# Altium schematic sheet RF_FILTER_Sheet1.SchDoc
size A; SheetNumber: 1; SheetTotal: 1
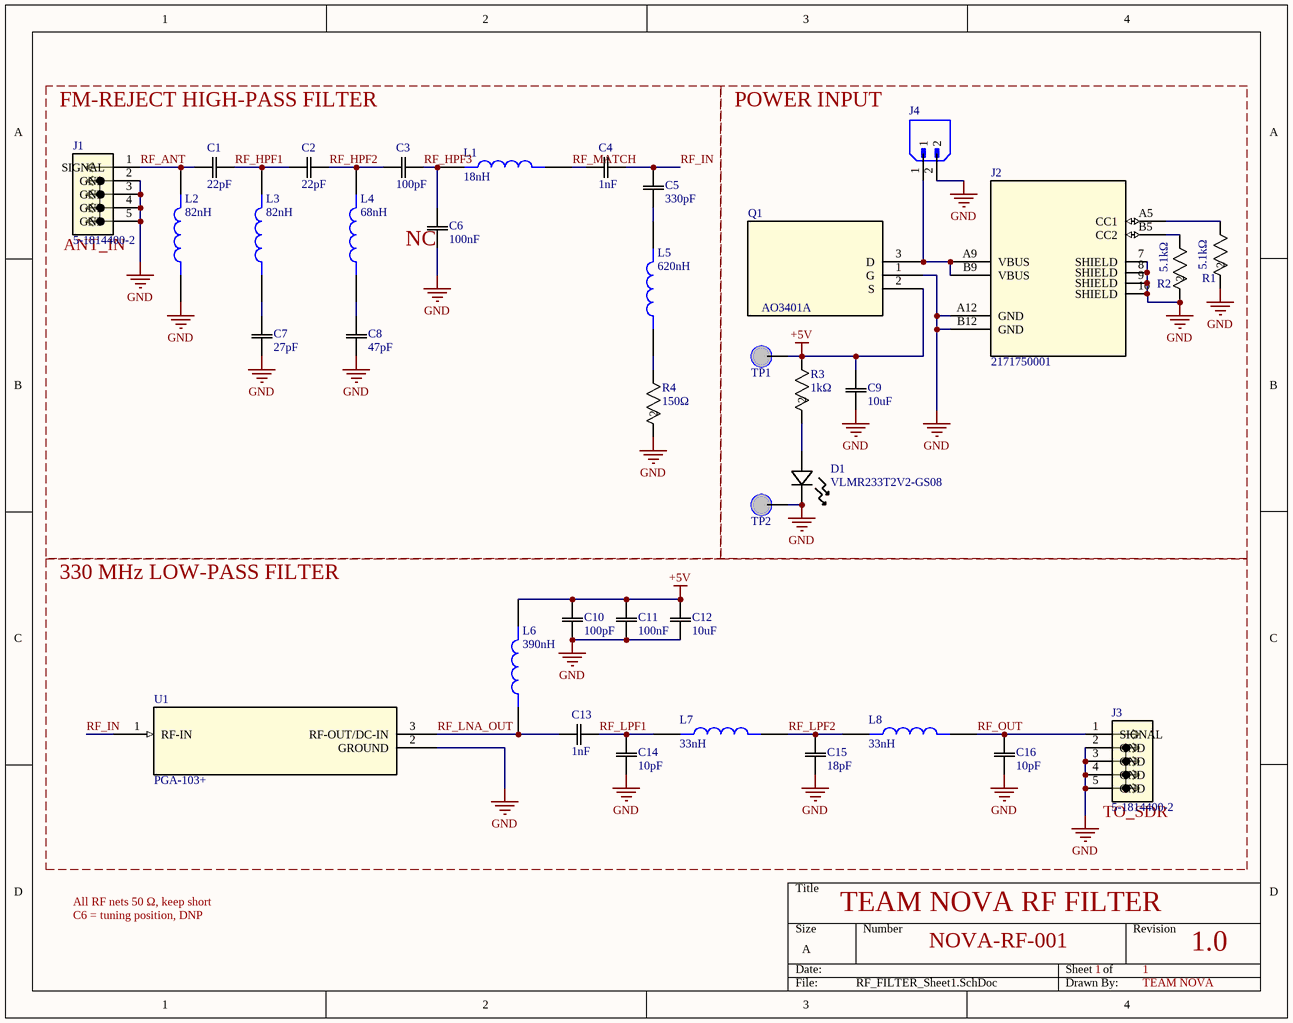
[diagram p0: RF_FILTER_Sheet1.SchDoc]

## Parts
C1  22pF  [CAPC220145_88N_KEM]
C2  22pF  [CAPC220145_88N_KEM]
C3  100pF  [CAPC220145_88N_KEM]
C4  1nF  [CAPC220145_88N_KEM]
C5  330pF  [CAPC220145_88N_KEM]
C6  100nF  [CAPC220145_88N_KEM]
C7  27pF  [CAPC220145_88N_KEM]
C8  47pF  [CAPC220145_88N_KEM]
C9  10uF  [CAPC220145_88N_KEM]
C10  100pF  [CAPC220145_88N_KEM]
C11  100nF  [CAPC220145_88N_KEM]
C12  10uF  [CAPC220145_88N_KEM]
C13  1nF  [CAPC220145_88N_KEM]
C14  10pF  [CAPC220145_88N_KEM]
C15  18pF  [CAPC220145_88N_KEM]
C16  10pF  [CAPC220145_88N_KEM]
D1  VLMR233T2V2-GS08  [LED_VISHAY_VLMX233_VIS]
J1  5-1814400-2  [COAX4GND_5-1814400-2_TEC]
J2  2171750001  [2171750001_MOL]
J3  5-1814400-2  [COAX4GND_5-1814400-2_TEC]
J4  B2B-XH-A(LF)(SN)  [JST_B2B-XH-A]  (value not drawn)
L1  18nH  [IND_AISC-0805-R082J-T]
L2  82nH  [IND_AISC-0805-R082J-T]
L3  82nH  [IND_AISC-0805-R082J-T]
L4  68nH  [IND_AISC-0805-R082J-T]
L5  620nH  [IND_AISC-0805-R082J-T]
L6  390nH  [IND_AISC-0805-R082J-T]
L7  33nH  [IND_AISC-0805-R082J-T]
L8  33nH  [IND_AISC-0805-R082J-T]
Q1  AO3401A  [SOT-23-3L_AOS]
R1  5.1kΩ  [RC0805N_YAG]
R2  5.1kΩ  [RC0805N_YAG]
R3  1kΩ  [RC0805N_YAG]
R4  150Ω  [RC0805N_YAG]
TP1  TestPoint  [TP_PTH_1.0]  (value not drawn)  (no BOM)
TP2  TestPoint  [TP_PTH_1.0]  (value not drawn)  (no BOM)
U1  PGA-103+  [DF782_MNC-M]

## Blocks framed on the sheet
POWER INPUT: C9 D1 J2 J4 Q1 R1-R3 TP1 TP2
330 MHz LOW-PASS FILTER: C10-C16 J3 L6-L8 U1

## Nets
+5V: C9.2 C10.2 C11.2 C12.2 L6.2 Q1.2(S) R3.1 TP1.1
GND: C6.1 C7.1 C8.1 C9.1 C10.1 C11.1 C12.1 C14.1 C15.1 C16.1 D1.1 J1.2(GND) J1.3(GND) J1.4(GND) J1.5(GND) J2.7(SHIELD) J2.8(SHIELD) J2.9(SHIELD) J2.10(SHIELD) J2.A12(GND) J2.B12(GND) J3.2(GND) J3.3(GND) J3.4(GND) J3.5(GND) J4.2 L2.1 Q1.1(G) R1.2 R2.2 R4.2 TP2.1 U1.2(GROUND)
RF_ANT: C1.1 J1.1(SIGNAL) L2.2
RF_HPF1: C1.2 C2.1 L3.2
RF_HPF2: C2.2 C3.1 L4.2
RF_HPF3: C3.2 C6.2 L1.1
RF_IN: C4.2 C5.2 U1.1(RF-IN)
RF_LNA_OUT: C13.1 L6.1 U1.3(RF-OUT/DC-IN)
RF_LPF1: C13.2 C14.2 L7.1
RF_LPF2: C15.2 L7.2 L8.1
RF_MATCH: C4.1 L1.2
RF_OUT: C16.2 J3.1(SIGNAL) L8.2
NetC5_1: C5.1 L5.2
NetC7_2: C7.2 L3.1
NetC8_2: C8.2 L4.1
NetD1_2: D1.2 R3.2
NetJ2_A5: J2.A5(CC1) R1.1
NetJ2_A9: J2.A9(VBUS) J2.B9(VBUS) J4.1 Q1.3(D)
NetJ2_B5: J2.B5(CC2) R2.1
NetL5_1: L5.1 R4.1

## Notes on the sheet
- FM-REJECT HIGH-PASS FILTER
- (near J1) ANT_IN
- (near C6) NC
- (near J3) TO_SDR
- All RF nets 50 Ω, keep short
- C6 = tuning position, DNP
- TEAM NOVA RF FILTER
- NOVA-RF-001
- 1
- 1.0
- TEAM NOVA

## Library data of the parts
C1 C2 = 0805CG220J500NT: CAP CER 22pF 50V C0G 0805; Manufacturer: FH (Guangdong Fenghua Advanced Tech); Manufacturer Part Number: 0805CG220J500NT; Value: 22pF; LCSC Part #: C24658
C3 C10 = 0805CG101J500NT: CAP CER 100pF 50V C0G 0805; Manufacturer: FH (Guangdong Fenghua Advanced Tech); Manufacturer Part Number: 0805CG101J500NT; Value: 100pF; LCSC Part #: C82028
C4 C13 = 0805CG102J500NT: CAP CER 1nF 50V C0G 0805; Manufacturer: FH (Guangdong Fenghua Advanced Tech); Manufacturer Part Number: 0805CG102J500NT; Value: 1nF; LCSC Part #: C29925
C5 = 0805CG331J500NT: CAP CER 330pF 50V C0G 0805; Manufacturer: FH (Guangdong Fenghua Advanced Tech); Manufacturer Part Number: 0805CG331J500NT; Value: 330pF; LCSC Part #: C1815
C6 C11 = 0805B104J500NT: CAP CER 100nF 50V X7R 0805; Manufacturer: FH (Guangdong Fenghua Advanced Tech); Manufacturer Part Number: 0805B104J500NT; Value: 100nF; LCSC Part #: C29926
C7 = 0805CG270J500NT: CAP CER 27pF 50V C0G 0805; Manufacturer: FH (Guangdong Fenghua Advanced Tech); Manufacturer Part Number: 0805CG270J500NT; Value: 27pF; LCSC Part #: C1808
C8 = 0805CG470J500NT: CAP CER 47pF 50V C0G 0805; Manufacturer: FH (Guangdong Fenghua Advanced Tech); Manufacturer Part Number: 0805CG470J500NT; Value: 47pF; LCSC Part #: C24659
C9 C12 = 0805X106K500NT: CAP CER 10uF 50V X5R 0805; Manufacturer: FH (Guangdong Fenghua Advanced Tech); Manufacturer Part Number: 0805X106K500NT; Value: 10uF; LCSC Part #: C6117579
C14 C16 = 0805CG100J500NT: CAP CER 10pF 50V C0G 0805; Manufacturer: FH (Guangdong Fenghua Advanced Tech); Manufacturer Part Number: 0805CG100J500NT; Value: 10pF; LCSC Part #: C157608
C15 = 0805CG180J500NT: CAP CER 18pF 50V C0G 0805; Manufacturer: FH (Guangdong Fenghua Advanced Tech); Manufacturer Part Number: 0805CG180J500NT; Value: 18pF; LCSC Part #: C1797
D1 = VLMR233T2V2-GS08: LED RED 0805 SMD; Manufacturer: Vishay; Value: Red LED; Manufacturer Part Number: VLMR233T2V2-GS08; LCSC Part #: C511093
J1 J3 = 5-1814400-2: CONN RCPT SMA TH; Manufacturer: TE Connectivity; Manufacturer Part Number: 5-1814400-2; LCSC Part #: C3174972; Value: SMA
J2 = 2171750001: TYPE C 6 PIN TOP MOUNT SMT; Manufacturer: Molex; Value: USB-C; Manufacturer Part Number: 2171750001; LCSC Part #: C3197922
J4 = B2B-XH-A(LF)(SN): CONN HEADER TH 2POS 2.5mm; Manufacturer: JST; Value: JST-XH 2P; Manufacturer Part Number: B2B-XH-A(LF)(SN); LCSC Part #: C158012
L1 = AHW2012C-18NJTF: FIXED IND 18nH 600mA 0.2Ω 0805; Manufacturer: APV; Manufacturer Part Number: AHW2012C-18NJTF; Value: 18nH; LCSC Part #: C6808029
L2 L3 = AHW2012C-82NJTF: FIXED IND 82nH 400mA 0.42Ω 0805; Manufacturer: APV; Manufacturer Part Number: AHW2012C-82NJTF; Value: 82nH; LCSC Part #: C6364713
L4 = AHW2012C-68NJTF: FIXED IND 68nH 500mA 0.38Ω 0805; Manufacturer: APV; Manufacturer Part Number: AHW2012C-68NJTF; Value: 68nH; LCSC Part #: C6808042
L5 = AHW2012C-R62JTF: FIXED IND 620nH 210mA 2.2Ω 0805; Manufacturer: APV; Manufacturer Part Number: AHW2012C-R62JTF; Value: 620nH; LCSC Part #: C19633939
L6 = AHW2012C-R39JTF: FIXED IND 0.39uH 290mA 1.5Ω 0805; Manufacturer: APV; Manufacturer Part Number: AHW2012C-R39JTF; Value: 390nH; LCSC Part #: C6808052
L7 L8 = AHW2012C-33NJTF: FIXED IND 33nH 500mA 0.27Ω 0805; Manufacturer: APV; Manufacturer Part Number: AHW2012C-33NJTF; Value: 33nH; LCSC Part #: C6808037
Q1 = AO3401A: MOSFET P-CH 30V 4A SOT-23; Manufacturer: Alpha & Omega Semiconductor; Manufacturer Part Number: AO3401A; LCSC Part #: C15127; Value: AO3401A
R1 R2 = RS-05K5101FT: RES 5.1kΩ ±1% 125mW 0805; Manufacturer: FH (Guangdong Fenghua Advanced Tech); Manufacturer Part Number: RS-05K5101FT; Value: 5.1kΩ; LCSC Part #: C118848
R3 = RS-05K102JT: RES 1kΩ ±5% 125mW 0805; Manufacturer: FH (Guangdong Fenghua Advanced Tech); Manufacturer Part Number: RS-05K102JT; Value: 1kΩ; LCSC Part #: C115302
R4 = RS-05K1500FT: RES 150Ω ±1% 125mW 0805; Manufacturer: FH (Guangdong Fenghua Advanced Tech); Manufacturer Part Number: RS-05K1500FT; Value: 150Ω; LCSC Part #: C304819
TP1 TP2 = TestPoint: Test point, 1.0 mm plated hole; LCSC Part #: N/A; Manufacturer Part Number: N/A; Manufacturer: N/A; Value: N/A
U1 = PGA-103+: RF Amplifier IC CATV, Cellular, DBS, MMDS, PCS, WLAN, Wireless LAN 50MHz ~ 4GHz SOT-89; Manufacturer: Mini-Circuits; Manufacturer Part Number: PGA-103+; LCSC Part #: C3008207; Value: PGA-103+